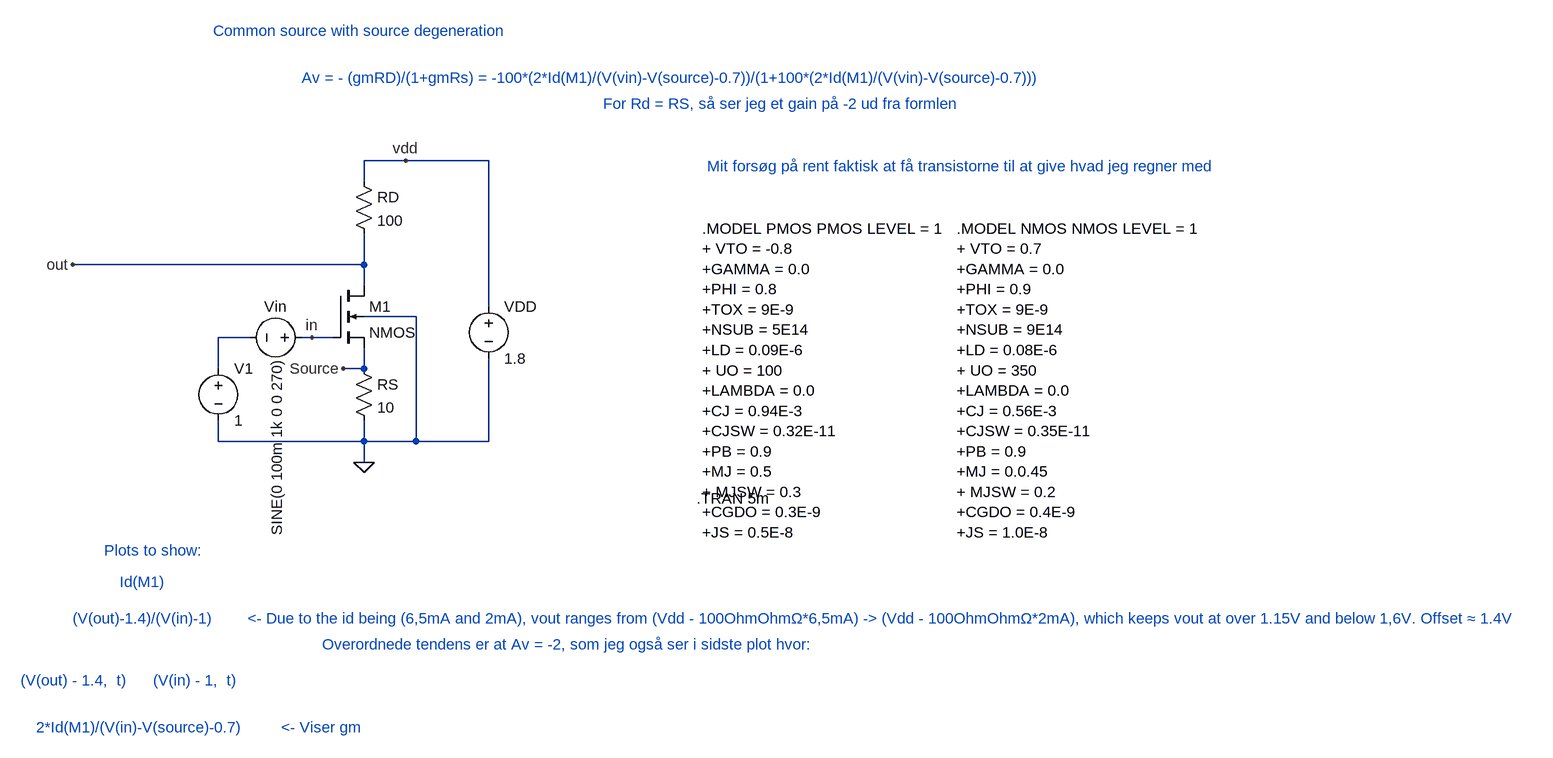
[diagram p0: schematic Lab1.asc]
Lab1.asc, the LTspice schematic file:
Version 4
SHEET 1 1296 792
WIRE -480 -96 -544 -96
WIRE -352 -96 -480 -96
WIRE -544 -64 -544 -96
WIRE -544 64 -544 16
WIRE -544 64 -992 64
WIRE -544 96 -544 64
WIRE -352 128 -352 -96
WIRE -464 144 -544 144
WIRE -720 176 -768 176
WIRE -624 176 -640 176
WIRE -592 176 -624 176
WIRE -768 224 -768 176
WIRE -544 224 -544 192
WIRE -544 224 -576 224
WIRE -768 336 -768 304
WIRE -544 336 -544 304
WIRE -544 336 -768 336
WIRE -464 336 -464 144
WIRE -464 336 -544 336
WIRE -352 336 -352 208
WIRE -352 336 -464 336
WIRE -544 368 -544 336
FLAG -544 368 0
FLAG -992 64 out
FLAG -576 224 Source
FLAG -480 -96 vdd
FLAG -624 176 in
SYMBOL nmos4 -592 96 R0
SYMATTR InstName M1
SYMATTR Value2 l=0.18u w=18u
SYMBOL Voltage -624 176 R90
WINDOW 0 -32 56 VBottom 2
WINDOW 3 169 70 Bottom 2
SYMATTR InstName Vin
SYMATTR Value SINE(0 100m 1k 0 0 270)
SYMBOL Voltage -352 112 R0
SYMATTR InstName VDD
SYMATTR Value 1.8
SYMBOL Res -560 -80 R0
SYMATTR InstName RD
SYMATTR Value 100
SYMBOL Res -560 208 R0
SYMATTR InstName RS
SYMATTR Value 10
SYMBOL Voltage -768 208 R0
SYMATTR InstName V1
SYMATTR Value 1
TEXT -24 8 Left 2 !.MODEL PMOS PMOS LEVEL = 1\n+ VTO = -0.8\n+GAMMA = 0.0\n+PHI = 0.8\n+TOX = 9E-9\n+NSUB = 5E14\n+LD = 0.09E-6\n+ UO = 100\n+LAMBDA = 0.0\n+CJ = 0.94E-3\n+CJSW = 0.32E-11\n+PB = 0.9\n+MJ = 0.5\n+ MJSW = 0.3\n+CGDO = 0.3E-9\n+JS = 0.5E-8
TEXT 368 8 Left 2 !.MODEL NMOS NMOS LEVEL = 1\n+ VTO = 0.7\n+GAMMA = 0.0\n+PHI = 0.9\n+TOX = 9E-9\n+NSUB = 9E14\n+LD = 0.08E-6\n+ UO = 350\n+LAMBDA = 0.0\n+CJ = 0.56E-3\n+CJSW = 0.35E-11\n+PB = 0.9\n+MJ = 0.0.45\n+ MJSW = 0.2\n+CGDO = 0.4E-9\n+JS = 1.0E-8
TEXT -16 -88 Left 2 ;Mit forsøg på rent faktisk at få transistorne til at give hvad jeg regner med
TEXT -776 -296 Left 2 ;Common source with source degeneration
TEXT -640 -224 Left 2 ;Av = - (gmRD)/(1+gmRs) = -100*(2*Id(M1)/(V(vin)-V(source)-0.7))/(1+100*(2*Id(M1)/(V(vin)-V(source)-0.7)))
TEXT -176 -184 Left 2 ;For Rd = RS, så ser jeg et gain på -2 ud fra formlen
TEXT -32 424 Left 2 !.TRAN 5m
TEXT -944 504 Left 2 ;Plots to show:
TEXT -992 608 Left 2 ;(V(out)-1.4)/(V(in)-1)		<- Due to the id being (6,5mA and 2mA), vout ranges from (Vdd - 100OhmOhmΩ*6,5mA) -> (Vdd - 100OhmOhmΩ*2mA), which keeps vout at over 1.15V and below 1,6V. Offset ≈ 1.4V
TEXT -920 552 Left 2 ;Id(M1)
TEXT -608 648 Left 2 ;Overordnede tendens er at Av = -2, som jeg også ser i sidste plot hvor:
TEXT -1072 704 Left 2 ;(V(out) - 1.4,  t)      (V(in) - 1,  t)
TEXT -1048 776 Left 2 ;2*Id(M1)/(V(in)-V(source)-0.7) 		<- Viser gm

The netlist it stands for:
* Lab1.asc
M1 out in Source 0 NMOS l=0.18u w=18u
Vin in N001 SINE(0 100m 1k 0 0 270)
VDD vdd 0 1.8
RD vdd out 100
RS Source 0 10
V1 N001 0 1
.model NMOS NMOS
.model PMOS PMOS
.lib standard.mos
.MODEL PMOS PMOS LEVEL = 1
+ VTO = -0.8
+GAMMA = 0.0
+PHI = 0.8
+TOX = 9E-9
+NSUB = 5E14
+LD = 0.09E-6
+ UO = 100
+LAMBDA = 0.0
+CJ = 0.94E-3
+CJSW = 0.32E-11
+PB = 0.9
+MJ = 0.5
+ MJSW = 0.3
+CGDO = 0.3E-9
+JS = 0.5E-8
.MODEL NMOS NMOS LEVEL = 1
+ VTO = 0.7
+GAMMA = 0.0
+PHI = 0.9
+TOX = 9E-9
+NSUB = 9E14
+LD = 0.08E-6
+ UO = 350
+LAMBDA = 0.0
+CJ = 0.56E-3
+CJSW = 0.35E-11
+PB = 0.9
+MJ = 0.0.45
+ MJSW = 0.2
+CGDO = 0.4E-9
+JS = 1.0E-8
* Mit forsøg på rent faktisk at få transistorne til at give hvad jeg regner med
* Common source with source degeneration
* Av = - (gmRD)/(1+gmRs) = -100*(2*Id(M1)/(V(vin)-V(source)-0.7))/(1+100*(2*Id(M1)/(V(vin)-V(source)-0.7)))
* For Rd = RS, så ser jeg et gain på -2 ud fra formlen
.TRAN 5m
* Plots to show:
* (V(out)-1.4)/(V(in)-1)		<- Due to the id being (6,5mA and 2mA), vout ranges from (Vdd - 100OhmOhmΩ*6,5mA) -> (Vdd - 100OhmOhmΩ*2mA), which keeps vout at over 1.15V and below 1,6V. Offset ≈ 1.4V
* Id(M1)
* Overordnede tendens er at Av = -2, som jeg også ser i sidste plot hvor:
* (V(out) - 1.4,  t)      (V(in) - 1,  t)
* 2*Id(M1)/(V(in)-V(source)-0.7) 		<- Viser gm
.backanno
.end